# Altium schematic sheet MONO65_A2_s07 [PSU].SchDoc
size A3; DocumentNumber: 7; SheetNumber: 7; SheetTotal: 7
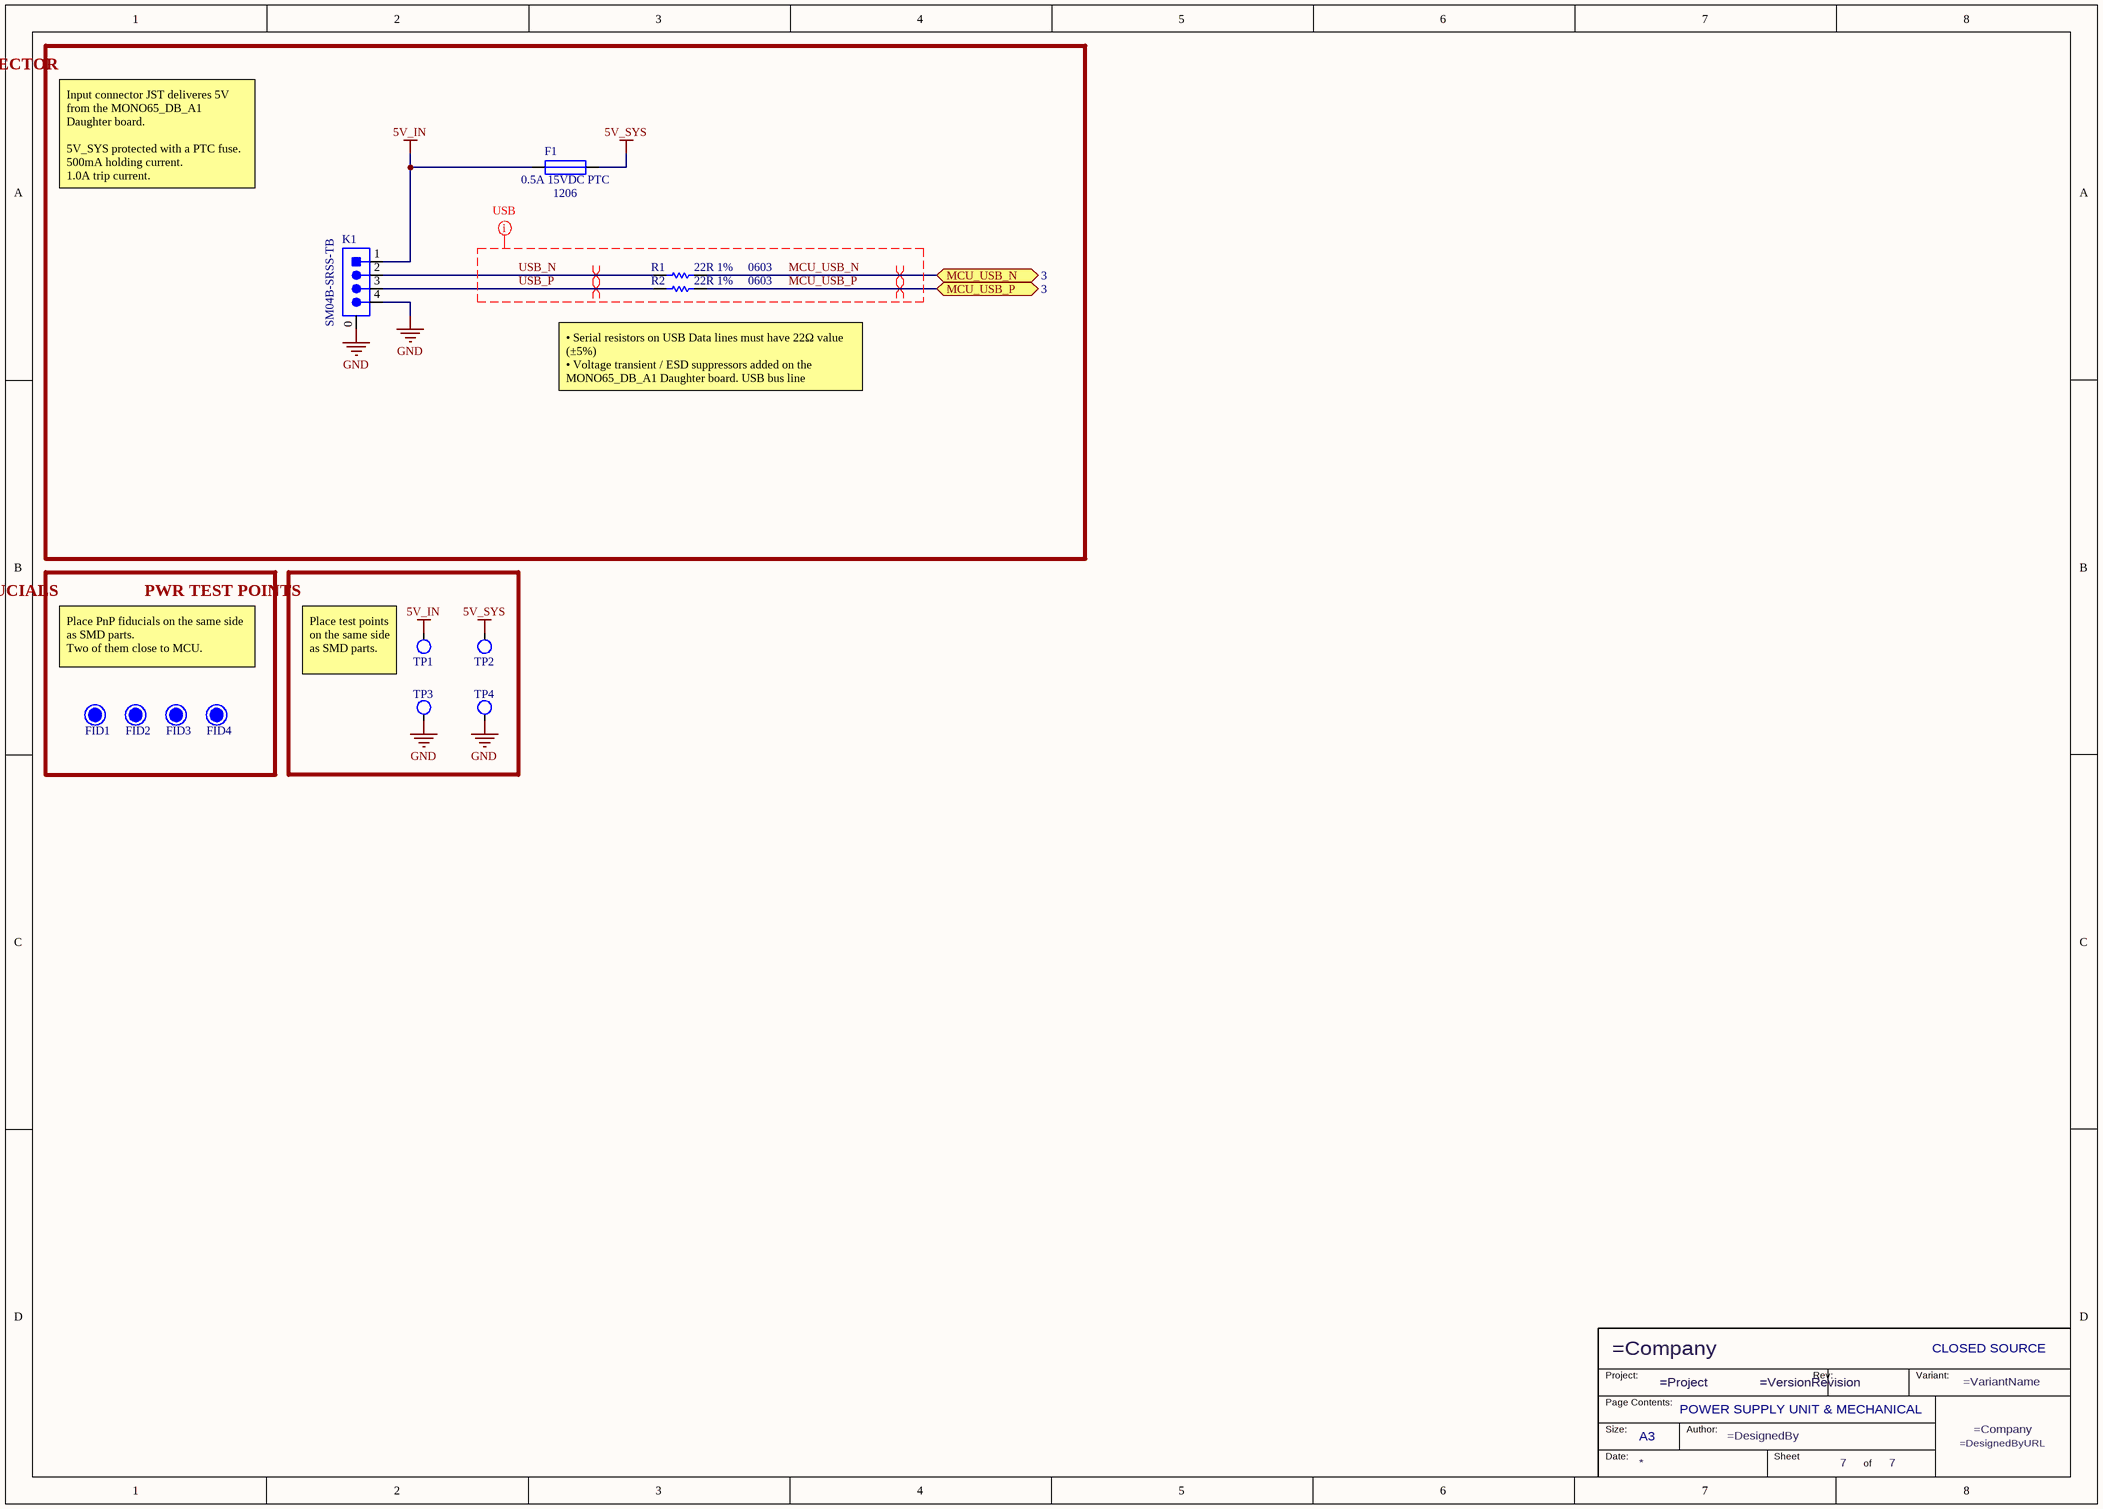
[diagram p0: MONO65_A2_s07 [PSU].SchDoc]

## Parts
F1  0.5A 15VDC PTC  Case/Package: 1206  [PTC3116X06N]
FID1  FIDUCIAL 1MM  [FID 1mm]  (value not drawn)  (no BOM)
FID2  FIDUCIAL 1MM  [FID 1mm]  (value not drawn)  (no BOM)
FID3  FIDUCIAL 1MM  [FID 1mm]  (value not drawn)  (no BOM)
FID4  FIDUCIAL 1MM  [FID 1mm]  (value not drawn)  (no BOM)
K1  SM04B-SRSS-TB  [SM04B-SRSS-TB]
R1  22R 1%  Case/Package: 0603  [RESC1608X04N]
R2  22R 1%  Case/Package: 0603  [RESC1608X04N]
TB*?  PageContents: POWER SUPPLY UNIT & MECHANICAL  Licence: CLOSED SOURCE  Size: A3  (hidden comment: TBL TitleBlock 01)  (graphical)
TP1  TP SMD 0.6mm  [TP SMD 0.6mm]  (value not drawn)  (no BOM)
TP2  TP SMD 0.6mm  [TP SMD 0.6mm]  (value not drawn)  (no BOM)
TP3  TP SMD 0.6mm  [TP SMD 0.6mm]  (value not drawn)  (no BOM)
TP4  TP SMD 0.6mm  [TP SMD 0.6mm]  (value not drawn)  (no BOM)

## Blocks framed on the sheet
INPUT CONNECTOR: F1 K1 R1 R2
PNP FIDUCIALS: FID1-FID4
PWR TEST POINTS: TP1-TP4

## Ports
MCU_USB_N (bidir, see 3), MCU_USB_P (bidir, see 3)

## Nets
5V_IN: F1.1 K1.1 TP1.1
5V_SYS: F1.2 TP2.1
GND: K1.0 K1.4 TP3.1 TP4.1
MCU_USB_N: R1.2 ; port MCU_USB_N
MCU_USB_P: R2.2 ; port MCU_USB_P
USB_N: K1.2 R1.1
USB_P: K1.3 R2.1

## Layout directives
differential pair; differential pair class DIFF_90Ohm_USB: MCU_USB_N, MCU_USB_P, USB_N, USB_P
net class USB: MCU_USB_N, MCU_USB_P, USB_N, USB_P

## Notes on the sheet
- Input connector JST deliveres 5V from the MONO65_DB_A1 Daughter board.
  5V_SYS protected with a PTC fuse.
  500mA holding current.
  1.0A trip current.
- • Serial resistors on USB Data lines must have 22Ω value (±5%)
  • Voltage transient / ESD suppressors added on the MONO65_DB_A1 Daughter board. USB bus line
- Place PnP fiducials on the same side as SMD parts.
  Two of them close to MCU.
- (near TP1) Place test points on the same side as SMD parts.
- (in symbol TBL TitleBlock 01) Project:; Rev:; Variant:; Page Contents:; Size:; Author:; Date:; Sheet; of

## Library data of the parts
F1 = FUS FUS 1206 15VDC 0.5A PTC 1206L050/15YR: PTC Resettable Fuse 0.5A (hold) 1A (trip) 15VDC 100A peak 0.6W 0.1sek 0.15Ohm SMD 1206; Manufacturer: Littelfuse; Resistance: 750mR; Max Voltage Rating (DC): 15V; Power Dissipation: 600mW; Hold Current: 500mA; Time to Trip: 0.1s; Approvals: cULus,TUV; Supplier 1: Digi-Key; Manufacturer Part Number: 1206L050/15YR; Stock 1: 3891; Pricing 1: 1 = 0,49000, 5 = 0,47200, 10 = 0,45700, 50 = 0,38480, 100 = 0,31940, 250 = 0,29040, 500 = 0,24684, 1000 = 0,21780 (USD); RoHS: Yes; Case Code (Metric): 3216; Case Code (Imperial): 1206; Min Operating Temperature: -40°C; Max Operating Temperature: 85°C; Max Current Rating: 100A; Packaging: Tape and Reel; Current Rating: 100A; Package Quantity: 4000; Termination: SMD/SMT; Working Voltage: 15V; Voltage Rating (DC): 15V; Operating Supply Voltage: 15V; Trip Current: 1A; Series: POLY-FUSE®, 1206L; Lead Free: Lead Free; RoHS Compliant: Yes; ComponentLink1URL: https://datasheet.ciiva.com/14102/1206l-eng-datasheet-14102822.pdf?src-supplier=Distrelec; ComponentLink1Description: https://datasheet.ciiva.com/14102/1206l-eng-datasheet-14102822.pdf?src-supplier=Distrelec; ComponentLink2URL: https://datasheet.ciiva.com/16321/littelfuse-1206l-16321387.pdf?src-supplier=Future+Electronics; ComponentLink2Description: https://datasheet.ciiva.com/16321/littelfuse-1206l-16321387.pdf?src-supplier=Future+Electronics; ComponentLink3URL: https://datasheet.ciiva.com/325/littelfuse-ptc-1206l-325756.pdf?src-supplier=Digi-Key; ComponentLink3Description: https://datasheet.ciiva.com/325/littelfuse-ptc-1206l-325756.pdf?src-supplier=Digi-Key; ComponentLink4URL: https://datasheet.ciiva.com/325/littelfuse-ptc-1206l-325757.pdf?src-supplier=Digi-Key; ComponentLink4Description: https://datasheet.ciiva.com/325/littelfuse-ptc-1206l-325757.pdf?src-supplier=Digi-Key; ComponentLink5URL: https://datasheet.ciiva.com/325/littelfuse-ptc-1206l-325758.pdf?src-supplier=Digi-Key; ComponentLink5Description: https://datasheet.ciiva.com/325/littelfuse-ptc-1206l-325758.pdf?src-supplier=Digi-Key; Supplier Part Number 1: F3733CT-ND
FID1-FID4 = FID 1MM: P&P Fiducial point, 1mm diameter
K1 = CON B2W HYB B2B SM04B-SRSS-TB: 4pin PHD 1mm SMD JST - SM04B-SRSS-TB - Pin Header, Wire-to-Board, 1 Rows, 4 Contacts, SR Series; Connector Type: Header,Male Pin; Number of Positions: 4; Voltage Rating: 50V; Gender: Male; Supplier 1: Digi-Key; Manufacturer: JST; Manufacturer Part Number: SM04B-SRSS-TB; Stock 1: 0; RoHS: Yes; Mount: Surface Mount; Housing Material: Nylon; Contact Plating: Tin,Lead; Housing Color: Natural; Contact Material: Copper Alloy; Contact Shape: Square; Insulation Material: Nylon; Insulation Color: Natural; Min Operating Temperature: -25°C; Max Operating Temperature: 85°C; Number of Rows: 1; Packaging: Cut Tape; Termination: Solder; Orientation: Horizontal; Fastening Type: Push,Pull; Insulation Height: 0.114inch; Lead Free: Contains Lead; Flammability Rating: UL94 V-0; REACH SVHC: No SVHC; ComponentLink1URL: https://media.digikey.com/pdf/Data%20Sheets/JST%20PDFs/SR%20Connector.pdf?src-supplier=Digi-Key; ComponentLink1Description: https://media.digikey.com/pdf/Data%20Sheets/JST%20PDFs/SR%20Connector.pdf?src-supplier=Digi-Key; Supplier Part Number 1: 455-1422-1-ND
R1 R2 = RES SMD 22R 1% 0603: SMD RESISTOR 22R 1% 0603 0.1W; Manufacturer: Yageo; Manufacturer Part Number: RC0603FR-0722RL; Temperature Coefficient: 100ppm/°C; Voltage Rating (DC): 50V; Power Rating: 100mW; Supplier 1: Digi-Key; Stock 1: 829965; Pricing 1: 1 = 0,10000, 10 = 0,02400, 100 = 0,00970, 1000 = 0,00436, 2500 = 0,00378 (USD); RoHS: Yes; Number of Pins: 2; Case Code (Metric): 1608; Case Code (Imperial): 0603; Size Code: 0603; Min Operating Temperature: -55°C; Max Operating Temperature: 155°C; Tolerance: 1%; Resistance: 22R; Resistor Type: Thick Film; Packaging: Tape and Reel; Voltage Rating: 50V; Package Quantity: 1; Number of Terminations: 2; Termination: SMD/SMT; Max Power Dissipation: 100mW; Features: Moisture Resistant; Series: RC; Resistance Tolerance: 1%; Technology: THICK FILM; Construction: Rectangular; Length: 1.6mm; Width: 0.031inch; Height: 0.022inch; Depth: 0.8mm; REACH SVHC: No SVHC; Lead Free: Lead Free; Military Standard: Not; RoHS Compliant: Yes; ComponentLink1URL: https://datasheet.ciiva.com/11819/0900766b80f96399-11819285.pdf?src-supplier=RSComponents; ComponentLink1Description: https://datasheet.ciiva.com/11819/0900766b80f96399-11819285.pdf?src-supplier=RSComponents; ComponentLink2URL: https://datasheet.ciiva.com/2454/pyu-r-int-thick-7-2454354.pdf?src-supplier=Digi-Key; ComponentLink2Description: https://datasheet.ciiva.com/2454/pyu-r-int-thick-7-2454354.pdf?src-supplier=Digi-Key; ComponentLink3URL: https://datasheet.ciiva.com/2454/pyu-r-int-thick-7-2454355.pdf?src-supplier=Digi-Key; ComponentLink3Description: https://datasheet.ciiva.com/2454/pyu-r-int-thick-7-2454355.pdf?src-supplier=Digi-Key; ComponentLink4URL: https://datasheet.ciiva.com/2454/pyu-r-int-thick-7-2454356.pdf?src-supplier=Digi-Key; ComponentLink4Description: https://datasheet.ciiva.com/2454/pyu-r-int-thick-7-2454356.pdf?src-supplier=Digi-Key; ComponentLink5URL: https://datasheet.ciiva.com/46440/1868787-46440901.pdf?src-supplier=Element14; ComponentLink5Description: https://datasheet.ciiva.com/46440/1868787-46440901.pdf?src-supplier=Element14; ComponentLink6URL: https://datasheet.ciiva.com/46395/443971-46395032.pdf?src-supplier=Element14; ComponentLink6Description: https://datasheet.ciiva.com/46395/443971-46395032.pdf?src-supplier=Element14; Supplier Part Number 1: 311-22.0HRCT-ND
TB*? = TBL TitleBlock 01: Custom Title block
TP1-TP4 = TPT SMD 60: Test Point SMD 0.6mm